# Altium project TMAG5170_MODULE.PrjPcb
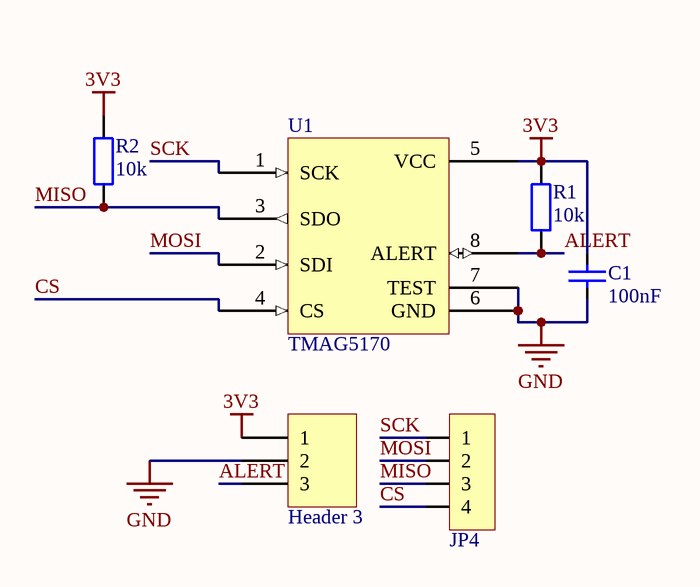
[diagram p0: Sheet1.SchDoc]
1 sheet, 6 parts. Net scope: global (net labels, ports and power ports of the same name join across sheets).
Board file: PCB1.PcbDoc

## Sheet Sheet1.SchDoc
size A4; SheetNumber: 1; SheetTotal: 1

### Parts
C1  100nF  [CAP_0603]
C3  JP4  [JP4-C1T]
P1  Header 3  [HDR1X3]
R1  10k  [RES-SMD-0603]
R2  10k  [RES-SMD-0603]
U1  TMAG5170  [SOP8]

### Nets
3V3: C1.2 P1.1 R1.1 R2.1 U1.5(VCC)
GND: C1.1 P1.2 U1.6(GND) U1.7(TEST)
ALERT: P1.3 R1.2 U1.8(ALERT)
CS: C3.4 U1.4(CS)
MISO: C3.3 R2.2 U1.3(SDO)
MOSI: C3.2 U1.2(SDI)
SCK: C3.1 U1.1(SCK)

### Library data of the parts
C1 = CapSMD: Capacitor; Value: 33p; Published: 8-Jun-2000; LatestRevisionDate: 17-Jul-2002; LatestRevisionNote: Re-released for DXP Platform.; PackageReference: RAD-0.3; Publisher: Altium Limited
C3 = JP4: WR-PHD 2.54 mm Angled Socket Header; Manufacturer: W¨¹rth Elektronik eiSos GmbH; partNo: 613004143121; ComponentLink1 Description: Manufacturer; ComponentLink2 Description: Datasheet; NoPins: 04; Created Date: 29 March 2013; ComponentLink1URL: http://www.we-online.com; ComponentLink2URL: http://katalog.we-online.de/em/datasheet/6130xx143121.pdf; Created by: Karrer Zheng
P1 = Header 3: Header, 3-Pin; LatestRevisionDate: 17-Jul-2002; LatestRevisionNote: Re-released for DXP Platform.; Publisher: Altium Limited
R1 R2 = Resistor - SMD: Resistor SMD; Manufacturer: Generic Components; Class: Passive; Published: 08/06/2000; Publisher: Altium Hobart Technology Centre